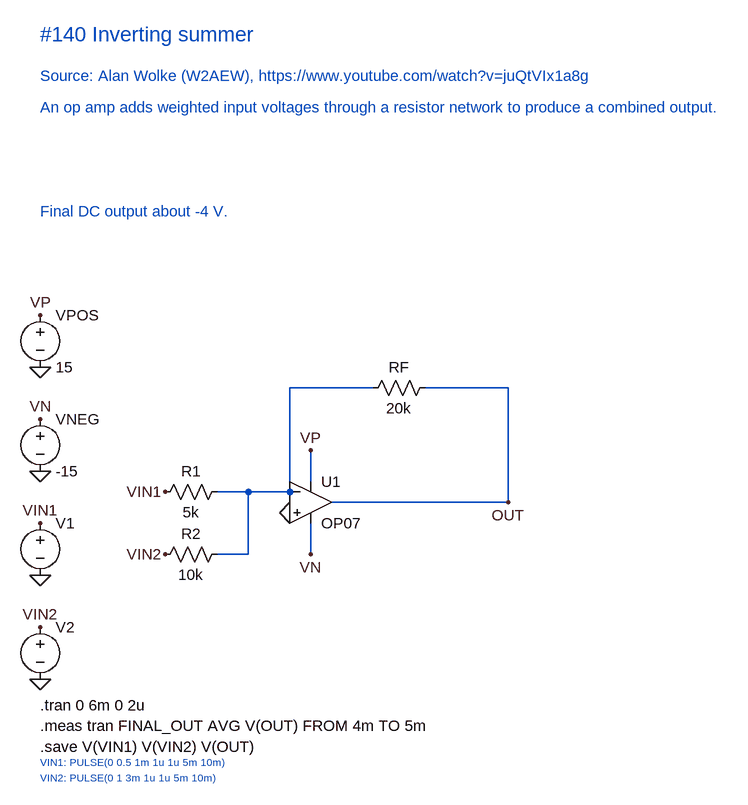
[diagram p0: schematic Inverting summer.asc]
Inverting summer.asc, the LTspice schematic file:
Version 4.1
SHEET 1 1220 740
WIRE 512 128 512 288
WIRE 640 128 512 128
WIRE 848 128 720 128
WIRE 848 304 848 128
WIRE 848 304 576 304
WIRE 544 272 544 224
FLAG 544 224 VP
WIRE 544 336 544 384
FLAG 544 384 VN
FLAG 128 16 VP
FLAG 128 96 0
FLAG 128 176 VN
FLAG 128 256 0
FLAG 128 336 VIN1
FLAG 128 416 0
FLAG 128 496 VIN2
FLAG 128 576 0
FLAG 848 304 OUT
SYMBOL voltage 128 0 R0
SYMATTR InstName VPOS
SYMATTR Value 15
SYMBOL voltage 128 160 R0
SYMATTR InstName VNEG
SYMATTR Value -15
SYMBOL voltage 128 320 R0
WINDOW 3 0 0 Invisible 2
SYMATTR InstName V1
SYMATTR Value PULSE(0 0.5 1m 1u 1u 5m 10m)
SYMBOL voltage 128 480 R0
WINDOW 3 0 0 Invisible 2
SYMATTR InstName V2
SYMATTR Value PULSE(0 1 3m 1u 1u 5m 10m)
SYMBOL OpAmps\OP07 544 240 R0
SYMATTR InstName U1
SYMATTR Value2 OP07
SYMBOL res 736 112 R90
WINDOW 0 0 56 VBottom 2
WINDOW 3 32 56 VTop 2
SYMATTR InstName RF
WIRE 400 288 512 288
WIRE 448 288 448 384
WIRE 448 384 400 384
FLAG 512 320 0
FLAG 320 288 VIN1
FLAG 320 384 VIN2
SYMATTR Value 20k
SYMBOL res 416 272 R90
WINDOW 0 0 56 VBottom 2
WINDOW 3 32 56 VTop 2
SYMATTR InstName R1
SYMATTR Value 5k
SYMBOL res 416 368 R90
WINDOW 0 0 56 VBottom 2
WINDOW 3 32 56 VTop 2
SYMATTR InstName R2
SYMATTR Value 10k
TEXT 128 616 Left 2 !.tran 0 6m 0 2u
TEXT 128 648 Left 2 !.meas tran FINAL_OUT AVG V(OUT) FROM 4m TO 5m
TEXT 128 680 Left 2 !.save V(VIN1) V(VIN2) V(OUT)
TEXT 128 704 Left 1 ;VIN1: PULSE(0 0.5 1m 1u 1u 5m 10m)
TEXT 128 728 Left 1 ;VIN2: PULSE(0 1 3m 1u 1u 5m 10m)
TEXT 128 -144 Left 2 ;Final DC output about -4 V.
TEXT 128 -416 Left 3 ;#140 Inverting summer
TEXT 128 -352 Left 2 ;Source: Alan Wolke (W2AEW), https://www.youtube.com/watch?v=juQtVIx1a8g
TEXT 128 -304 Left 2 ;An op amp adds weighted input voltages through a resistor network to produce a combined output.

The netlist it stands for:
* Inverting summer.asc
VPOS VP 0 15
VNEG VN 0 -15
V1 VIN1 0 PULSE(0 0.5 1m 1u 1u 5m 10m)
V2 VIN2 0 PULSE(0 1 3m 1u 1u 5m 10m)
X§U1 0 N001 VP VN OUT OP07  ; pins In+ In- V+ V- OUT
RF OUT N001 20k
R1 N001 VIN1 5k
R2 N001 VIN2 10k
.tran 0 6m 0 2u
.meas tran FINAL_OUT AVG V(OUT) FROM 4m TO 5m
.save V(VIN1) V(VIN2) V(OUT)
* VIN1: PULSE(0 0.5 1m 1u 1u 5m 10m)
* VIN2: PULSE(0 1 3m 1u 1u 5m 10m)
* Final DC output about -4 V.
* #140 Inverting summer
* Source: Alan Wolke (W2AEW), https://www.youtube.com/watch?v=juQtVIx1a8g
* An op amp adds weighted input voltages through a resistor network to produce a combined output.
.lib LTC.lib
.backanno
.end